# Altium schematic sheet Power_supply1.SchDoc
size 420 x 297 mm; Address1: Address1; Address2: Address2; Address3: Address3; Address4: Address4; DocumentNumber: *Э3; SheetNumber: 4; SheetTotal: 5; DocumentType: Схема электрическая *
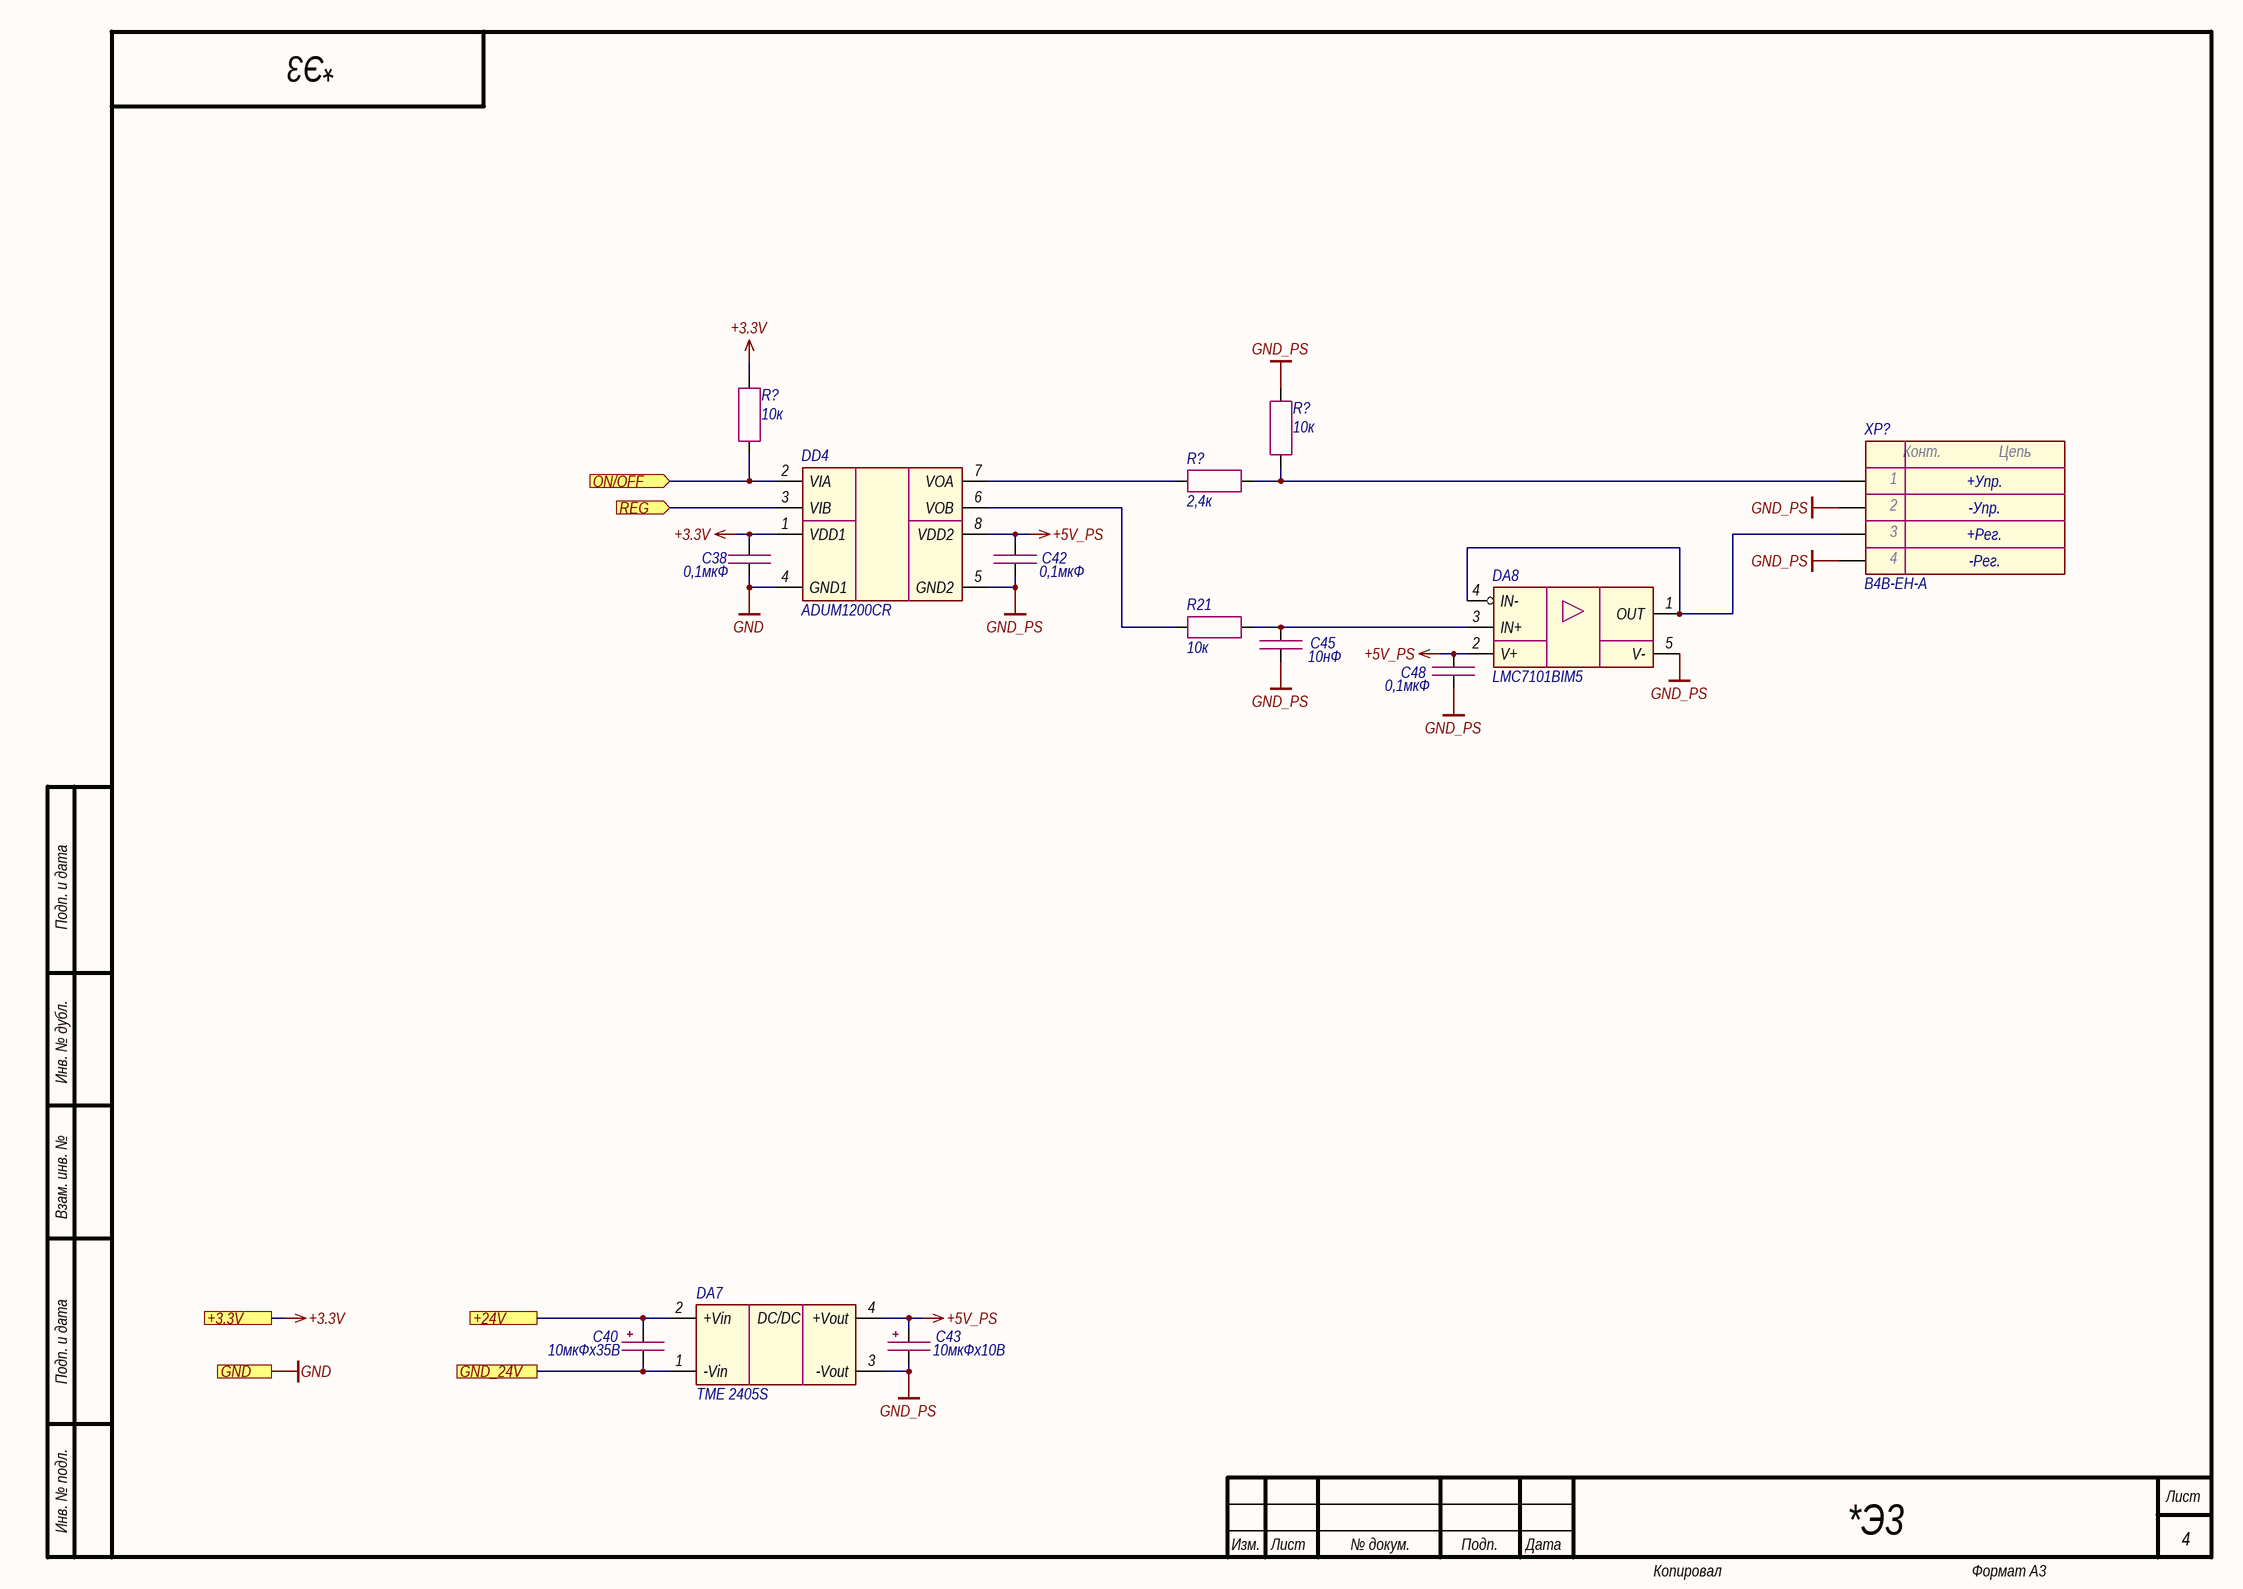
[diagram p0: Power_supply1.SchDoc]

## Parts
(Parts that share a designator on the sheet are numbered #1, #2 ... from top to bottom, then left to right.)
C38  0,1мкФ  [CAP_0603]
C40  10мкФх35B  [CAP_C]
C42  0,1мкФ  [CAP_0603]
C43  10мкФх10B  [CAP_A]
C45  10нФ  [CAP_0603]
C48  0,1мкФ  [CAP_0603]
DA7  TME 2405S  [TME (SIP-4)]
DA8  LMC7101BIM5  [SOT-23-5]
DD4  ADUM1200CR  [SOIC-8]
R21  10к  [RES_0603]
R?#1  10к  [RES_0603]
R?#2  10к  [RES_0603]
R?#3  2,4к  [RES_0603]
XP?  B4B-EH-A  [B4B-EH-A]

## Ports
+3.3V (see Main[2B], LD_driver[1D]), +24V (see Main[2B], LD_driver[1D]), GND (see Main[2B], LD_driver[1D]), GND_24V (see Main[2B], LD_driver[1D]), ON/OFF (in, see Main[1B]), REG (in, see Main[1B])

## Nets
+3.3V: C38.1 DD4.1(VDD1) R?#1.1 ; port +3.3V
+5V_PS: C42.1 C43.1 C48.1 DA7.4(+Vout) DA8.2(V+) DD4.8(VDD2)
GND: C38.2 DD4.4(GND1) ; port GND
GND_PS: C42.2 C43.2 C45.2 C48.2 DA7.3(-Vout) DA8.5(V-) DD4.5(GND2) R?#2.2 XP?.2 XP?.4
+24V: C40.1 DA7.2(+Vin) ; port +24V
GND_24V: C40.2 DA7.1(-Vin) ; port GND_24V
ON/OFF: DD4.2(VIA) R?#1.2 ; port ON/OFF
REG: DD4.3(VIB) ; port REG
NetC45_1: C45.1 DA8.3(IN+) R21.2
NetDA8_1: DA8.1(OUT) DA8.4(IN-) XP?.3
NetDD4_6: DD4.6(VOB) R21.1
NetDD4_7: DD4.7(VOA) R?#3.2
NetR?#2_1: R?#2.1 R?#3.1 XP?.1

## Notes on the sheet
- +Упр.
- -Упр.
- +Рег.
- -Рег.
- Подп. и дата
- Инв. № дубл.
- Взам. инв. №
- Инв. № подл.
- Изм.
- Лист
- № докум.
- Подп.
- Дата
- Копировал
- Формат А3
- (in symbol Connector-4) Конт.; Цепь
- (in symbol TME) DC/DC

## Library data of the parts
C38 C42 C48 = Capacitor: Manufacturer: Murata; Model: GRM188R71H104KA93D; Value: 0,1мкФ; Document: *
C40 = Capacitor_Polar: Model: TECAP, 10 мкФ, 35 В, тип C, 10%; Value: 10мкФх35B; Document: *; Manufacturer: *
C43 = Capacitor_Polar: Model: TECAP, 10 мкФ, 10 В, тип A, 10%; Value: 10мкФх10B; Document: *; Manufacturer: *
C45 = Capacitor: Manufacturer: Murata; Model: GRM188R71H103JA01D; Value: 10нФ; Document: *
DA7 = TME: Manufacturer: Traco Power; Model: TME 2405S; Document: *
DA8 = LMC7101: Manufacturer: Texas Instruments; Model: LMC7101BIM5; Document: *
DD4 = ADUM1200: Manufacturer: Analog Devices; Model: ADUM1200CR; Document: *
R21 R?#1 R?#2 = Resistor: Manufacturer: Yageo; Model: RC0603FR-0710KL; Value: 10к; Document: *
R?#3 = Resistor: Manufacturer: Yageo; Model: RC0603FR-072K4L; Value: 2,4к; Document: *
XP? = Connector-4: Manufacturer: JST; Model: B4B-EH-A; Document: *